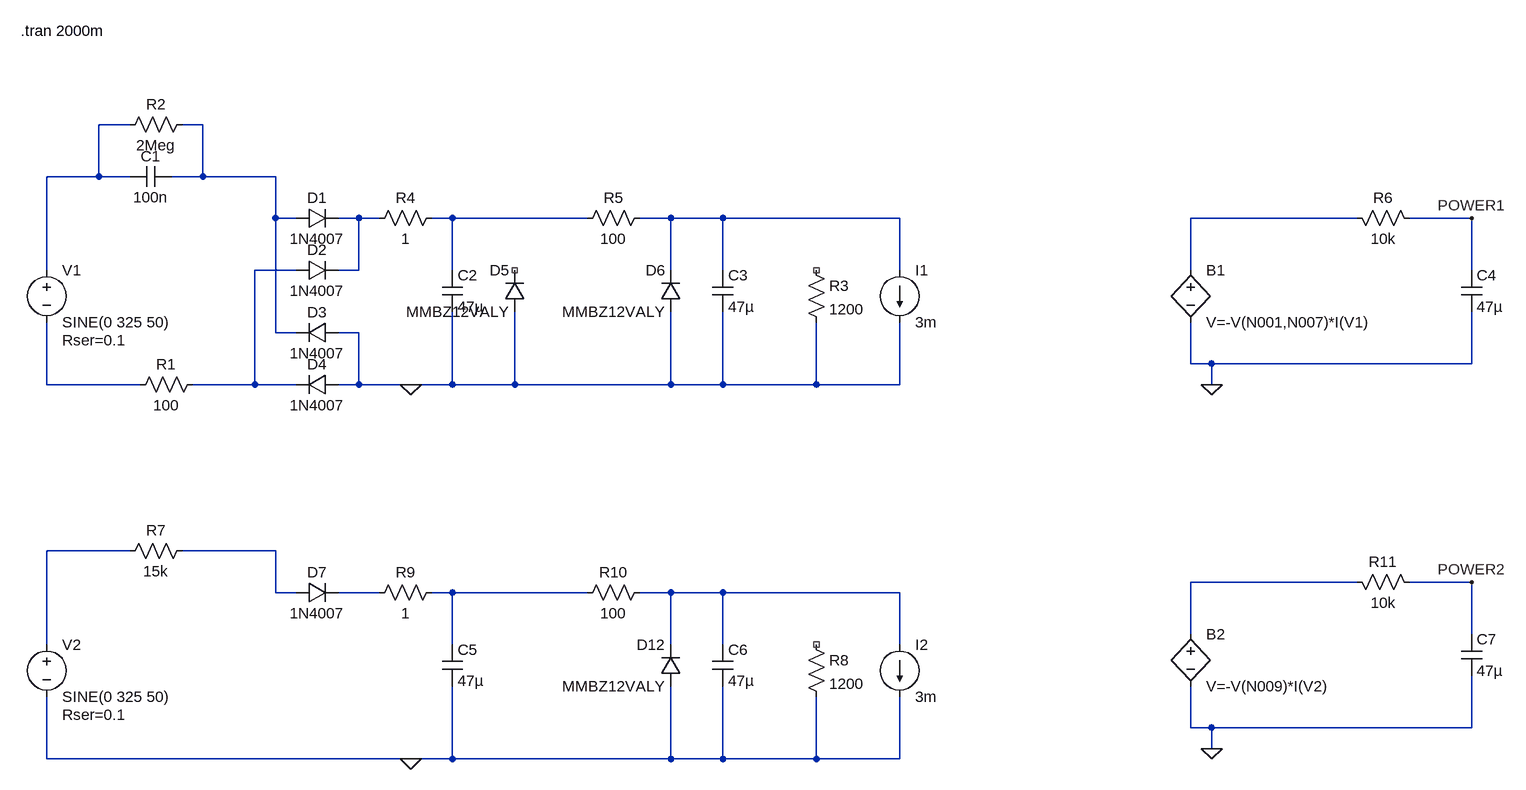
[diagram p0: schematic capacitor_dropper_mains.asc]
capacitor_dropper_mains.asc, the LTspice schematic file:
Version 4.1
SHEET 1 2344 928
WIRE 208 -96 160 -96
WIRE 320 -96 288 -96
WIRE 160 -16 160 -96
WIRE 160 -16 80 -16
WIRE 208 -16 160 -16
WIRE 320 -16 320 -96
WIRE 320 -16 272 -16
WIRE 432 -16 320 -16
WIRE 432 48 432 -16
WIRE 464 48 432 48
WIRE 560 48 528 48
WIRE 592 48 560 48
WIRE 704 48 672 48
WIRE 912 48 704 48
WIRE 1040 48 992 48
WIRE 1120 48 1040 48
WIRE 1392 48 1120 48
WIRE 2096 48 1840 48
WIRE 2272 48 2176 48
WIRE 80 128 80 -16
WIRE 464 128 400 128
WIRE 560 128 560 48
WIRE 560 128 528 128
WIRE 704 128 704 48
WIRE 1040 128 1040 48
WIRE 1120 128 1120 48
WIRE 1392 128 1392 48
WIRE 1840 128 1840 48
WIRE 2272 128 2272 48
WIRE 432 224 432 48
WIRE 464 224 432 224
WIRE 560 224 528 224
WIRE 1840 272 1840 208
WIRE 1872 272 1840 272
WIRE 2272 272 2272 192
WIRE 2272 272 1872 272
WIRE 80 304 80 208
WIRE 224 304 80 304
WIRE 400 304 400 128
WIRE 400 304 304 304
WIRE 464 304 400 304
WIRE 560 304 560 224
WIRE 560 304 528 304
WIRE 640 304 560 304
WIRE 704 304 704 192
WIRE 704 304 640 304
WIRE 800 304 800 192
WIRE 800 304 704 304
WIRE 1040 304 1040 192
WIRE 1040 304 800 304
WIRE 1120 304 1120 192
WIRE 1120 304 1040 304
WIRE 1264 304 1264 208
WIRE 1264 304 1120 304
WIRE 1392 304 1392 208
WIRE 1392 304 1264 304
WIRE 1872 304 1872 272
WIRE 208 560 80 560
WIRE 432 560 288 560
WIRE 2096 608 1840 608
WIRE 2272 608 2176 608
WIRE 432 624 432 560
WIRE 464 624 432 624
WIRE 592 624 528 624
WIRE 704 624 672 624
WIRE 912 624 704 624
WIRE 1040 624 992 624
WIRE 1120 624 1040 624
WIRE 1392 624 1120 624
WIRE 1840 688 1840 608
WIRE 2272 688 2272 608
WIRE 80 704 80 560
WIRE 704 704 704 624
WIRE 1040 704 1040 624
WIRE 1120 704 1120 624
WIRE 1392 704 1392 624
WIRE 1840 832 1840 768
WIRE 1872 832 1840 832
WIRE 2272 832 2272 752
WIRE 2272 832 1872 832
WIRE 1872 864 1872 832
WIRE 80 880 80 784
WIRE 640 880 80 880
WIRE 704 880 704 768
WIRE 704 880 640 880
WIRE 1040 880 1040 768
WIRE 1040 880 704 880
WIRE 1120 880 1120 768
WIRE 1120 880 1040 880
WIRE 1264 880 1264 784
WIRE 1264 880 1120 880
WIRE 1392 880 1392 784
WIRE 1392 880 1264 880
FLAG 640 304 0
FLAG 640 880 0
FLAG 1872 304 0
FLAG 2272 48 POWER1
FLAG 1872 864 0
FLAG 2272 608 POWER2
SYMBOL voltage 80 112 R0
WINDOW 123 0 0 Left 0
WINDOW 39 24 124 Left 2
SYMATTR SpiceLine Rser=0.1
SYMATTR InstName V1
SYMATTR Value SINE(0 325 50)
SYMBOL diode 464 64 R270
WINDOW 0 32 32 VTop 2
WINDOW 3 0 32 VBottom 2
SYMATTR InstName D1
SYMATTR Value 1N4007
SYMBOL diode 464 144 R270
WINDOW 0 32 32 VTop 2
WINDOW 3 0 32 VBottom 2
SYMATTR InstName D2
SYMATTR Value 1N4007
SYMBOL diode 528 208 R90
WINDOW 0 0 32 VBottom 2
WINDOW 3 32 32 VTop 2
SYMATTR InstName D3
SYMATTR Value 1N4007
SYMBOL diode 528 288 R90
WINDOW 0 0 32 VBottom 2
WINDOW 3 32 32 VTop 2
SYMATTR InstName D4
SYMATTR Value 1N4007
SYMBOL res 320 288 R90
WINDOW 0 0 56 VBottom 2
WINDOW 3 32 56 VTop 2
SYMATTR InstName R1
SYMATTR Value 100
SYMBOL res 304 -112 R90
WINDOW 0 0 56 VBottom 2
WINDOW 3 32 56 VTop 2
SYMATTR InstName R2
SYMATTR Value 2Meg
SYMBOL cap 272 -32 R90
WINDOW 0 0 32 VBottom 2
WINDOW 3 32 32 VTop 2
SYMATTR InstName C1
SYMATTR Value 100n
SYMATTR SpiceLine Rser=0.01
SYMBOL cap 688 128 R0
SYMATTR InstName C2
SYMATTR Value 47µ
SYMATTR SpiceLine Rser=1
SYMBOL diode 816 192 R180
WINDOW 0 24 64 Left 2
WINDOW 3 24 0 Left 2
SYMATTR InstName D5
SYMATTR Value MMBZ12VALY
SYMBOL res 1248 112 R0
SYMATTR InstName R3
SYMATTR Value 1200
SYMBOL res 688 32 R90
WINDOW 0 0 56 VBottom 2
WINDOW 3 32 56 VTop 2
SYMATTR InstName R4
SYMATTR Value 1
SYMBOL cap 1104 128 R0
SYMATTR InstName C3
SYMATTR Value 47µ
SYMATTR SpiceLine Rser=1
SYMBOL res 896 64 R270
WINDOW 0 32 56 VTop 2
WINDOW 3 0 56 VBottom 2
SYMATTR InstName R5
SYMATTR Value 100
SYMBOL diode 1056 192 R180
WINDOW 0 24 64 Left 2
WINDOW 3 24 0 Left 2
SYMATTR InstName D6
SYMATTR Value MMBZ12VALY
SYMBOL voltage 80 688 R0
WINDOW 123 0 0 Left 0
WINDOW 39 24 124 Left 2
SYMATTR SpiceLine Rser=0.1
SYMATTR InstName V2
SYMATTR Value SINE(0 325 50)
SYMBOL diode 464 640 R270
WINDOW 0 32 32 VTop 2
WINDOW 3 0 32 VBottom 2
SYMATTR InstName D7
SYMATTR Value 1N4007
SYMBOL res 192 576 R270
WINDOW 0 32 56 VTop 2
WINDOW 3 0 56 VBottom 2
SYMATTR InstName R7
SYMATTR Value 15k
SYMBOL cap 688 704 R0
SYMATTR InstName C5
SYMATTR Value 47µ
SYMATTR SpiceLine Rser=1
SYMBOL res 1248 688 R0
SYMATTR InstName R8
SYMATTR Value 1200
SYMBOL res 688 608 R90
WINDOW 0 0 56 VBottom 2
WINDOW 3 32 56 VTop 2
SYMATTR InstName R9
SYMATTR Value 1
SYMBOL cap 1104 704 R0
SYMATTR InstName C6
SYMATTR Value 47µ
SYMATTR SpiceLine Rser=1
SYMBOL res 896 640 R270
WINDOW 0 32 56 VTop 2
WINDOW 3 0 56 VBottom 2
SYMATTR InstName R10
SYMATTR Value 100
SYMBOL diode 1056 768 R180
WINDOW 0 24 64 Left 2
WINDOW 3 24 0 Left 2
SYMATTR InstName D12
SYMATTR Value MMBZ12VALY
SYMBOL current 1392 128 R0
WINDOW 123 0 0 Left 0
WINDOW 39 0 0 Left 0
SYMATTR InstName I1
SYMATTR Value 3m
SYMBOL current 1392 704 R0
WINDOW 123 0 0 Left 0
WINDOW 39 0 0 Left 0
SYMATTR InstName I2
SYMATTR Value 3m
SYMBOL bv 1840 112 R0
SYMATTR InstName B1
SYMATTR Value V=-V(N001,N007)*I(V1)
SYMBOL res 2080 32 M90
WINDOW 0 0 56 VBottom 2
WINDOW 3 32 56 VTop 2
SYMATTR InstName R6
SYMATTR Value 10k
SYMBOL cap 2256 128 R0
SYMATTR InstName C4
SYMATTR Value 47µ
SYMBOL bv 1840 672 R0
SYMATTR InstName B2
SYMATTR Value V=-V(N009)*I(V2)
SYMBOL res 2080 592 M90
WINDOW 0 0 56 VBottom 2
WINDOW 3 32 56 VTop 2
SYMATTR InstName R11
SYMATTR Value 10k
SYMBOL cap 2256 688 R0
SYMATTR InstName C7
SYMATTR Value 47µ
TEXT 40 -240 Left 2 !.tran 2000m

The netlist it stands for:
* capacitor_dropper_mains.asc
V1 N001 N008 SINE(0 325 50) Rser=0.1
D1 N002 N003 1N4007
D2 N007 N003 1N4007
D3 0 N002 1N4007
D4 0 N007 1N4007
R1 N007 N008 100
R2 N002 N001 2Meg
C1 N002 N001 100n Rser=0.01
C2 N004 0 47µ Rser=1
D5 0 NC_01 MMBZ12VALY
R3 NC_02 0 1200
R4 N004 N003 1
C3 N005 0 47µ Rser=1
R5 N004 N005 100
D6 0 N005 MMBZ12VALY
V2 N009 0 SINE(0 325 50) Rser=0.1
D7 N010 N012 1N4007
R7 N009 N010 15k
C5 N013 0 47µ Rser=1
R8 NC_03 0 1200
R9 N013 N012 1
C6 N014 0 47µ Rser=1
R10 N013 N014 100
D12 0 N014 MMBZ12VALY
I1 N005 0 3m
I2 N014 0 3m
B1 N006 0 V=-V(N001,N007)*I(V1)
R6 N006 POWER1 10k
C4 POWER1 0 47µ
B2 N011 0 V=-V(N009)*I(V2)
R11 N011 POWER2 10k
C7 POWER2 0 47µ
.model D D
.lib standard.dio
.tran 2000m
.backanno
.end